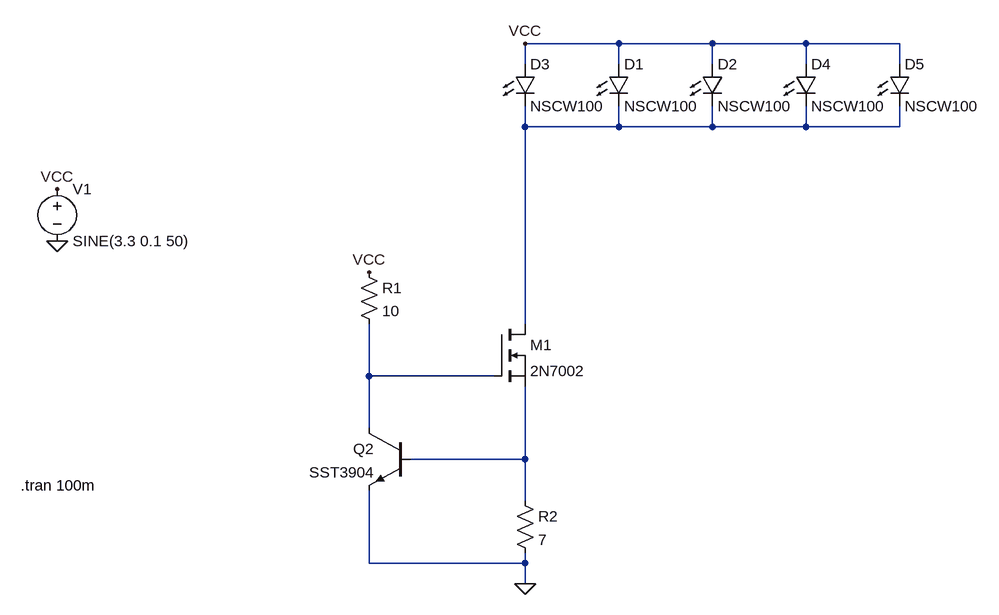
[diagram p0: schematic backlight_driver.asc]
backlight_driver.asc, the LTspice schematic file:
Version 4
SHEET 1 1084 680
WIRE 528 -224 384 -224
WIRE 672 -224 528 -224
WIRE 816 -224 672 -224
WIRE 960 -224 816 -224
WIRE 384 -192 384 -224
WIRE 528 -192 528 -224
WIRE 672 -192 672 -224
WIRE 816 -192 816 -224
WIRE 960 -192 960 -224
WIRE 384 -96 384 -128
WIRE 528 -96 528 -128
WIRE 528 -96 384 -96
WIRE 672 -96 672 -128
WIRE 672 -96 528 -96
WIRE 816 -96 816 -128
WIRE 816 -96 672 -96
WIRE 960 -96 960 -128
WIRE 960 -96 816 -96
WIRE 384 208 384 -96
WIRE 144 288 144 208
WIRE 336 288 144 288
WIRE 144 368 144 288
WIRE 384 416 384 304
WIRE 384 416 208 416
WIRE 384 480 384 416
WIRE 144 576 144 464
WIRE 384 576 384 560
WIRE 384 576 144 576
WIRE 384 608 384 576
FLAG -336 80 0
FLAG -336 0 VCC
FLAG 384 608 0
FLAG 144 128 VCC
FLAG 384 -224 VCC
SYMBOL voltage -336 -16 R0
WINDOW 123 0 0 Left 0
WINDOW 39 0 0 Left 0
SYMATTR InstName V1
SYMATTR Value SINE(3.3 0.1 50)
SYMBOL LED 368 -192 R0
SYMATTR InstName D3
SYMATTR Value NSCW100
SYMBOL LED 512 -192 R0
SYMATTR InstName D1
SYMATTR Value NSCW100
SYMBOL LED 656 -192 R0
SYMATTR InstName D2
SYMATTR Value NSCW100
SYMBOL LED 800 -192 R0
SYMATTR InstName D4
SYMATTR Value NSCW100
SYMBOL LED 944 -192 R0
SYMATTR InstName D5
SYMATTR Value NSCW100
SYMBOL res 128 112 R0
SYMATTR InstName R1
SYMATTR Value 10
SYMBOL res 368 464 R0
SYMATTR InstName R2
SYMATTR Value 7
SYMBOL npn 208 368 M0
SYMATTR InstName Q2
SYMATTR Value SST3904
SYMBOL nmos 336 208 R0
SYMATTR InstName M1
SYMATTR Value 2N7002
TEXT -392 456 Left 2 !.tran 100m

The netlist it stands for:
* backlight_driver.asc
V1 VCC 0 SINE(3.3 0.1 50)
D3 VCC N001 NSCW100
D1 VCC N001 NSCW100
D2 VCC N001 NSCW100
D4 VCC N001 NSCW100
D5 VCC N001 NSCW100
R1 VCC N002 10
R2 N003 0 7
Q2 N002 N003 0 0 SST3904
M1 N001 N002 N003 N003 2N7002
.model D D
.lib standard.dio
.model NPN NPN
.model PNP PNP
.lib standard.bjt
.model NMOS NMOS
.model PMOS PMOS
.lib standard.mos
.tran 100m
.backanno
.end